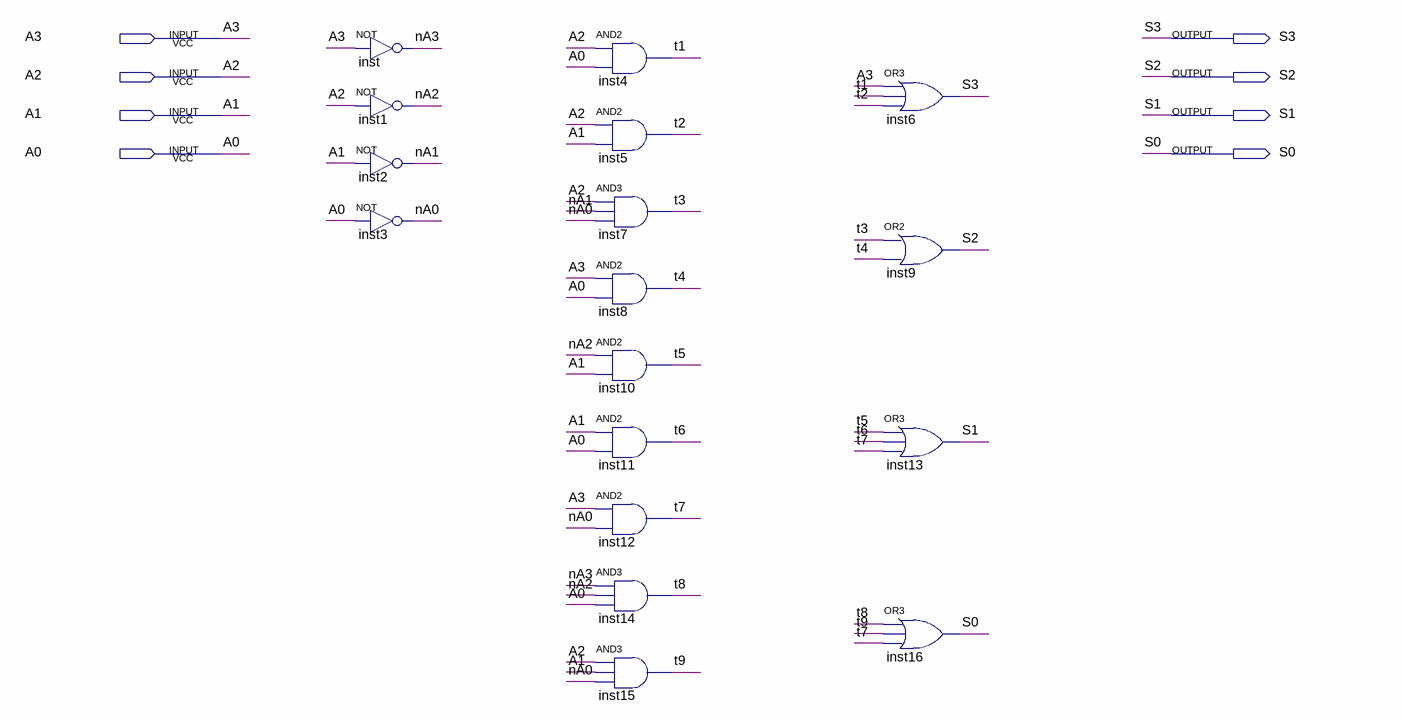
[diagram p0: schematic sheet]
// Quartus schematic add3.bdf as structural Verilog: 17 symbols, 8 pins
module add3 (
  input  A3,
  input  A2,
  input  A1,
  input  A0,
  output S3,
  output S2,
  output S1,
  output S0
);

  wire nA0, nA1, nA2, nA3, t1, t2, t3, t4, t5, t6, t7, t8, t9;

  not inst (nA3, A3);
  not inst1 (nA2, A2);
  not inst2 (nA1, A1);
  not inst3 (nA0, A0);
  and inst4 (t1, A2, A0);
  and inst5 (t2, A2, A1);
  and inst7 (t3, A2, nA1, nA0);
  and inst8 (t4, A3, A0);
  and inst10 (t5, nA2, A1);
  and inst11 (t6, A1, A0);
  and inst12 (t7, A3, nA0);
  and inst14 (t8, nA3, nA2, A0);
  and inst15 (t9, A2, A1, nA0);
  or inst6 (S3, A3, t1, t2);
  or inst9 (S2, t3, t4);
  or inst13 (S1, t5, t6, t7);
  or inst16 (S0, t8, t9, t7);
endmodule
